# Altium schematic sheet AT25256A_2.SchDoc
size 420 x 297 mm; Organization: Protel International P/L; PageSetup: Record=PageOptions|CenterHorizontal=True|CenterVertical=True|PrintScale=0.70|XCorrection=1.00|YCorrection=1.00|PrintKind=2|BorderSize=5000000|LeftOffset=0|BottomOffset=0|Orientation=2|PaperLength=1000|PaperWidth=1000|Scale=100|PaperSource=7|PrintQuality=-4|MediaType=1|DitherType=10|PaperKind=Custom 1: 210 x 297 mm.|PrintScaleMode=1; Razrabotal: Балобанов; Proveril: Шартдинов; NachKb: Рекалов; Nkontr: Завалина; Utv: Беккель; DecNum: ЦВИЯ.467239.035 Э3; Naim1: УУ; Naim2: Схема электрическая; Naim3: принципиальная; List: 1; Listov: 1; DecNum2: ЦВИЯ.467239.035 Э3
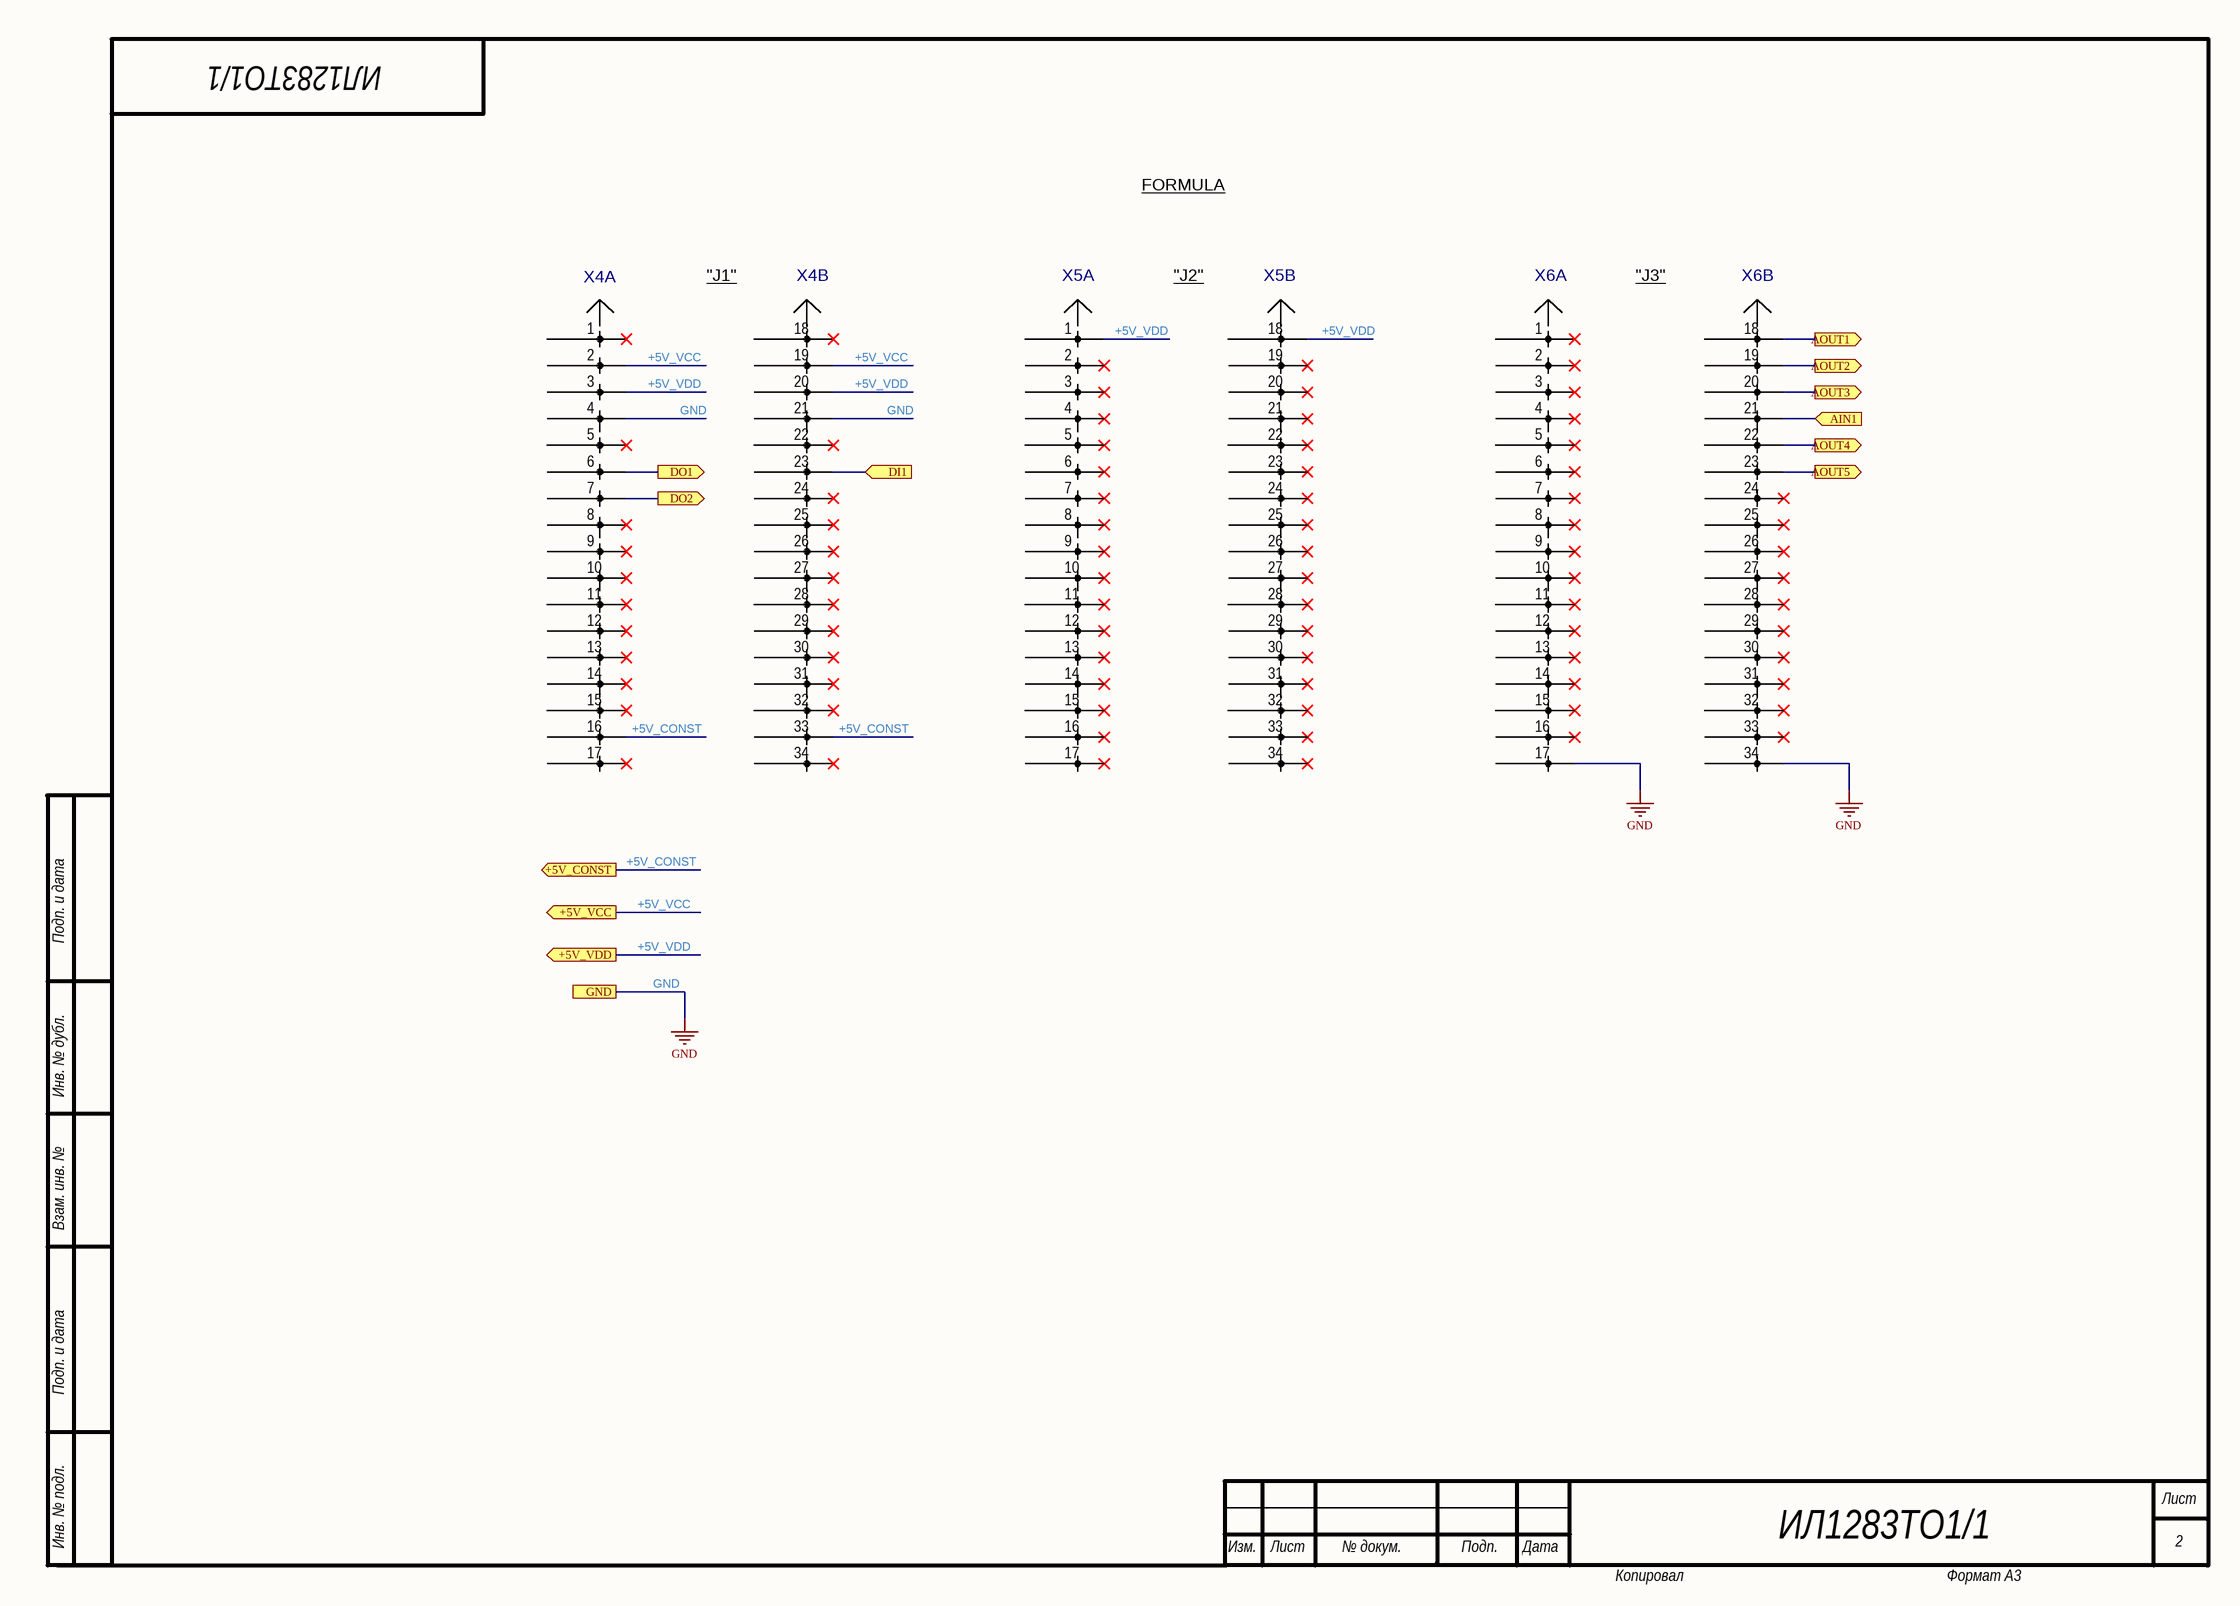
[diagram p0: AT25256A_2.SchDoc]

## Parts
X4  PBS34-2,54  [PBS34-2,54]  (value not drawn)  (parts A,B of 2)
X5  PBS34-2,54  [PBS34-2,54]  (value not drawn)  (parts A,B of 2)
X6  PBS34-2,54  [PBS34-2,54]  (value not drawn)  (parts A,B of 2)

## Ports
+5V_CONST (out), +5V_VCC (out), +5V_VDD (out), AIN1 (in), AOUT1 (out), AOUT2 (out), AOUT3 (out), AOUT4 (out), AOUT5 (out), DI1 (in), DO1 (out), DO2 (out), GND

## Nets
GND: X4.4 X4.21 X6.17 X6.34 ; port GND
+5V_CONST: X4.16 X4.33 ; port +5V_CONST
+5V_VCC: X4.2 X4.19 ; port +5V_VCC
+5V_VDD: X4.3 X4.20 X5.1 X5.18 ; port +5V_VDD
AIN1: X6.21 ; port AIN1
AOUT1: X6.18 ; port AOUT1
AOUT2: X6.19 ; port AOUT2
AOUT3: X6.20 ; port AOUT3
AOUT4: X6.22 ; port AOUT4
AOUT5: X6.23 ; port AOUT5
DI1: X4.23 ; port DI1
DO1: X4.6 ; port DO1
DO2: X4.7 ; port DO2

Not connected (* = marked no-connect by the designer): X4 1* 5* 8* 9* 10* 11* 12* 13* 14* 15* 17* 18* 22* 24* 25* 26* 27* 28* 29* 30* 31* 32* 34*; X5 2* 3* 4* 5* 6* 7* 8* 9* 10* 11* 12* 13* 14* 15* 16* 17* 19* 20* 21* 22* 23* 24* 25* 26* 27* 28* 29* 30* 31* 32* 33* 34*; X6 1* 2* 3* 4* 5* 6* 7* 8* 9* 10* 11* 12* 13* 14* 15* 16* 24* 25* 26* 27* 28* 29* 30* 31* 32* 33*

## Notes on the sheet
- ИЛ1283ТО1/1
- FORMULA
- "J1"
- "J2"
- "J3"
- Подп. и дата
- Инв. № дубл.
- Взам. инв. №
- Инв. № подл.
- Изм.
- Лист
- № докум.
- Подп.
- Дата
- 2
- Копировал
- Формат А3

## Library data of the parts
X4-X6 = PBS34-2,54: ComponentHeigt: 5.5; Name: Вилка; Specification: Вилка PLD2-2 *; Typ: PLD2-2; ClassName: *; Component Link: *; ComponentWeigt: *; Firme: *; Leadform: *; NN: *; KIND: *